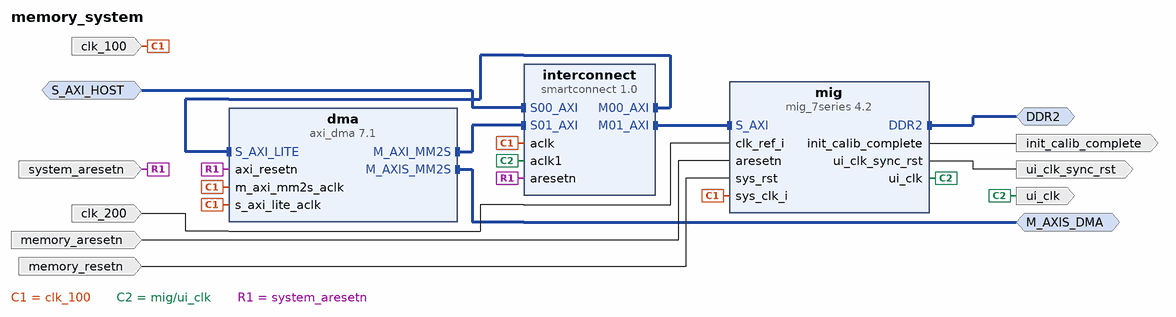
[diagram p0: block diagram of the top level]
# Vivado block design memory_system, xc7a100tcsg324-1, Vivado 2022.2
create_bd_design memory_system

create_bd_intf_port -mode Slave -vlnv xilinx.com:interface:aximm_rtl:1.0 S_AXI_HOST
set_property -dict [list \
  CONFIG.ADDR_WIDTH 32 \
  CONFIG.ARUSER_WIDTH 0 \
  CONFIG.AWUSER_WIDTH 0 \
  CONFIG.BUSER_WIDTH 0 \
  CONFIG.DATA_WIDTH 32 \
  CONFIG.FREQ_HZ 100000000 \
  CONFIG.HAS_BRESP 1 \
  CONFIG.HAS_BURST 1 \
  CONFIG.HAS_CACHE 1 \
  CONFIG.HAS_LOCK 1 \
  CONFIG.HAS_PROT 1 \
  CONFIG.HAS_QOS 1 \
  CONFIG.HAS_REGION 1 \
  CONFIG.HAS_RRESP 1 \
  CONFIG.HAS_WSTRB 1 \
  CONFIG.ID_WIDTH 0 \
  CONFIG.MAX_BURST_LENGTH 1 \
  CONFIG.NUM_READ_OUTSTANDING 1 \
  CONFIG.NUM_READ_THREADS 1 \
  CONFIG.NUM_WRITE_OUTSTANDING 1 \
  CONFIG.NUM_WRITE_THREADS 1 \
  CONFIG.PROTOCOL AXI4LITE \
  CONFIG.READ_WRITE_MODE READ_WRITE \
  CONFIG.RUSER_BITS_PER_BYTE 0 \
  CONFIG.RUSER_WIDTH 0 \
  CONFIG.SUPPORTS_NARROW_BURST 0 \
  CONFIG.WUSER_BITS_PER_BYTE 0 \
  CONFIG.WUSER_WIDTH 0 \
  CONFIG.master_id 2 \
] [get_bd_intf_ports S_AXI_HOST]
create_bd_intf_port -mode Master -vlnv xilinx.com:interface:axis_rtl:1.0 M_AXIS_DMA
create_bd_intf_port -mode Master -vlnv xilinx.com:interface:ddrx_rtl:1.0 DDR2
create_bd_port -dir I -type clk clk_100
set_property -dict [list \
  CONFIG.ASSOCIATED_BUSIF S_AXI_HOST:M_AXIS_DMA \
  CONFIG.ASSOCIATED_RESET system_aresetn \
  CONFIG.FREQ_HZ 100000000 \
] [get_bd_ports clk_100]
create_bd_port -dir I -type clk clk_200
set_property -dict {CONFIG.FREQ_HZ 200000000} [get_bd_ports clk_200]
create_bd_port -dir I -type rst system_aresetn
set_property -dict {CONFIG.POLARITY ACTIVE_LOW} [get_bd_ports system_aresetn]
create_bd_port -dir I -type rst memory_resetn
set_property -dict {CONFIG.POLARITY ACTIVE_LOW} [get_bd_ports memory_resetn]
create_bd_port -dir I -type rst memory_aresetn
set_property -dict {CONFIG.POLARITY ACTIVE_LOW} [get_bd_ports memory_aresetn]
create_bd_port -dir O -type clk ui_clk
set_property -dict {CONFIG.ASSOCIATED_RESET memory_aresetn} [get_bd_ports ui_clk]
create_bd_port -dir O -type rst ui_clk_sync_rst
create_bd_port -dir O init_calib_complete

create_bd_cell -type ip -vlnv xilinx.com:ip:mig_7series:4.2 mig
set_property -dict {CONFIG.XML_INPUT_FILE mig_ddr2.prj} [get_bd_cells mig]
create_bd_cell -type ip -vlnv xilinx.com:ip:axi_dma:7.1 dma
set_property -dict [list \
  CONFIG.c_addr_width 32 \
  CONFIG.c_include_mm2s 1 \
  CONFIG.c_include_mm2s_dre 0 \
  CONFIG.c_include_s2mm 0 \
  CONFIG.c_include_sg 0 \
  CONFIG.c_m_axi_mm2s_data_width 64 \
  CONFIG.c_m_axis_mm2s_tdata_width 64 \
  CONFIG.c_mm2s_burst_size 64 \
  CONFIG.c_sg_length_width 26 \
] [get_bd_cells dma]
create_bd_cell -type ip -vlnv xilinx.com:ip:smartconnect:1.0 interconnect
set_property -dict {CONFIG.NUM_CLKS 2 CONFIG.NUM_MI 2 CONFIG.NUM_SI 2} [get_bd_cells interconnect]

# ---- connections ----

connect_bd_intf_net [get_bd_intf_ports S_AXI_HOST] [get_bd_intf_pins interconnect/S00_AXI]
connect_bd_intf_net [get_bd_intf_ports M_AXIS_DMA] [get_bd_intf_pins dma/M_AXIS_MM2S]
connect_bd_intf_net [get_bd_intf_pins dma/M_AXI_MM2S] [get_bd_intf_pins interconnect/S01_AXI]
connect_bd_intf_net [get_bd_intf_pins interconnect/M00_AXI] [get_bd_intf_pins dma/S_AXI_LITE]
connect_bd_intf_net [get_bd_intf_pins interconnect/M01_AXI] [get_bd_intf_pins mig/S_AXI]
connect_bd_intf_net [get_bd_intf_ports DDR2] [get_bd_intf_pins mig/DDR2]
connect_bd_net -net clk_100_1 [get_bd_ports clk_100] \
  [get_bd_pins interconnect/aclk] [get_bd_pins dma/s_axi_lite_aclk] [get_bd_pins dma/m_axi_mm2s_aclk] \
  [get_bd_pins mig/sys_clk_i]
connect_bd_net -net clk_200_1 [get_bd_ports clk_200] [get_bd_pins mig/clk_ref_i]
connect_bd_net [get_bd_ports memory_aresetn] [get_bd_pins mig/aresetn]
connect_bd_net [get_bd_ports memory_resetn] [get_bd_pins mig/sys_rst]
connect_bd_net [get_bd_pins mig/init_calib_complete] [get_bd_ports init_calib_complete]
connect_bd_net [get_bd_pins mig/ui_clk] [get_bd_pins interconnect/aclk1] [get_bd_ports ui_clk]
connect_bd_net [get_bd_pins mig/ui_clk_sync_rst] [get_bd_ports ui_clk_sync_rst]
connect_bd_net [get_bd_ports system_aresetn] [get_bd_pins interconnect/aresetn] [get_bd_pins dma/axi_resetn]

# ---- address map ----
assign_bd_address -offset 0x80000000 -range 128M -target_address_space [get_bd_addr_spaces dma/Data_MM2S] [get_bd_addr_segs mig/memmap/memaddr]
exclude_bd_addr_seg -offset 0x40400000 -range 64K -target_address_space [get_bd_addr_spaces dma/Data_MM2S] [get_bd_addr_segs dma/S_AXI_LITE/Reg]
assign_bd_address -offset 0x40400000 -range 64K -target_address_space [get_bd_addr_spaces S_AXI_HOST] [get_bd_addr_segs dma/S_AXI_LITE/Reg]
assign_bd_address -offset 0x80000000 -range 128M -target_address_space [get_bd_addr_spaces S_AXI_HOST] [get_bd_addr_segs mig/memmap/memaddr]

validate_bd_design
save_bd_design
